# Altium schematic sheet Buck_converter.SchDoc
size B
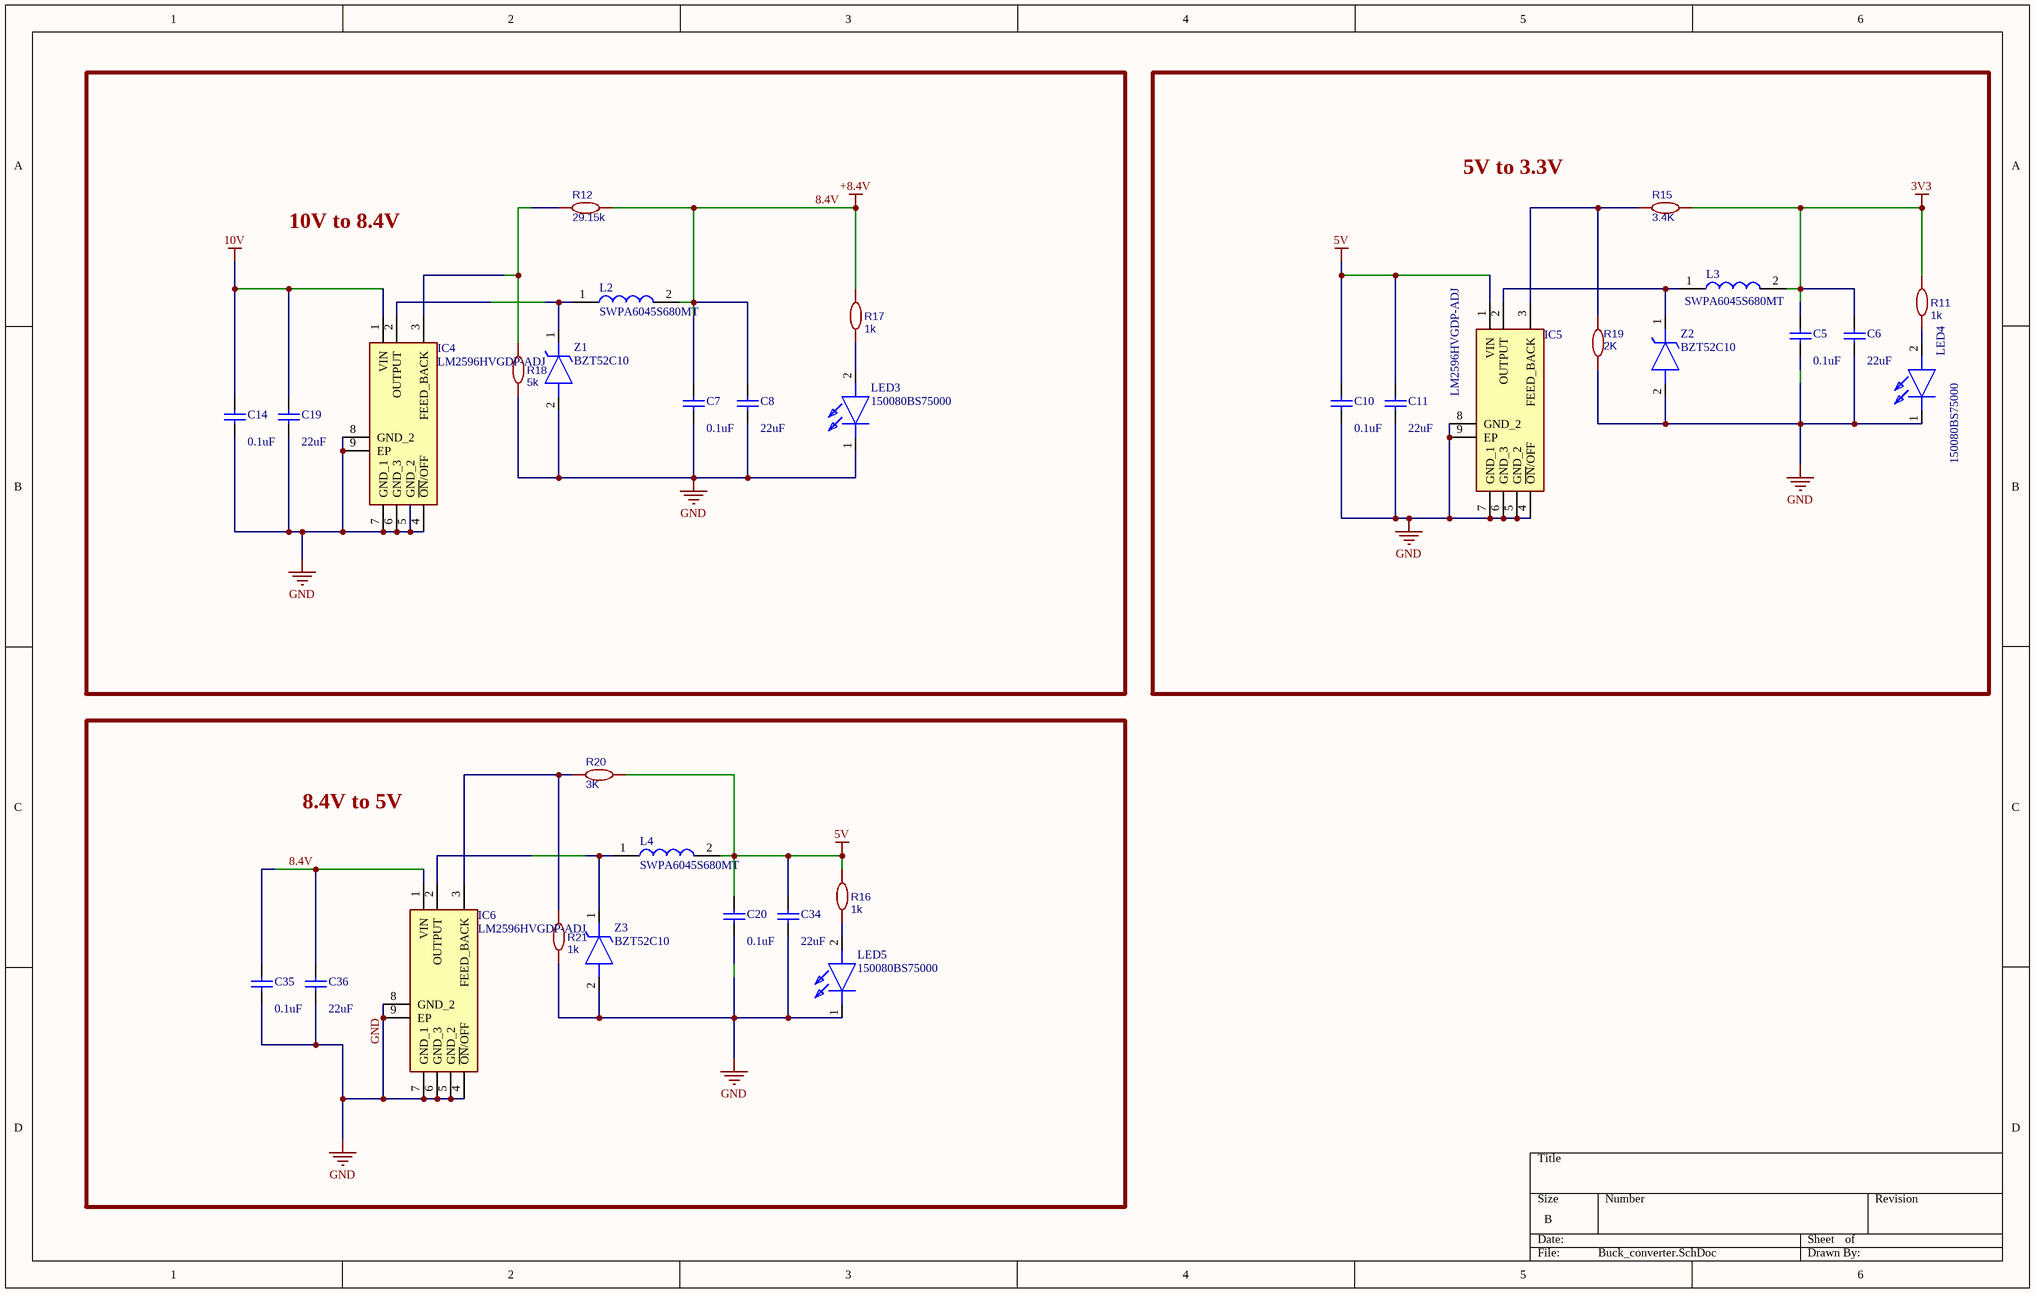
[diagram p0: Buck_converter.SchDoc]

## Parts
C5  value 0.1uF  [C0805]  (hidden comment: C1711)
C6  value 22uF  [C0805]  (hidden comment: C86816)
C7  value 0.1uF  [C0805]  (hidden comment: C1711)
C8  value 22uF  [C0805]  (hidden comment: C86816)
C10  value 0.1uF  [C0805]  (hidden comment: C1711)
C11  value 22uF  [C0805]  (hidden comment: C86816)
C14  value 0.1uF  [C0805]  (hidden comment: C1711)
C19  value 22uF  [C0805]  (hidden comment: C86816)
C20  value 0.1uF  [C0805]  (hidden comment: C1711)
C34  value 22uF  [C0805]  (hidden comment: C86816)
C35  value 0.1uF  [C0805]  (hidden comment: C1711)
C36  value 22uF  [C0805]  (hidden comment: C86816)
IC4  LM2596HVGDP-ADJ  [SOP-8-PP_L4.9-W3.9-P1.27-LS6.0-BL-EP]
IC5  LM2596HVGDP-ADJ  [SOP-8-PP_L4.9-W3.9-P1.27-LS6.0-BL-EP]
IC6  LM2596HVGDP-ADJ  [SOP-8-PP_L4.9-W3.9-P1.27-LS6.0-BL-EP]
L2  SWPA6045S680MT  [SWPA6045S680MT]
L3  SWPA6045S680MT  [SWPA6045S680MT]
L4  SWPA6045S680MT  [SWPA6045S680MT]
LED3  150080BS75000  [LEDC2012X80N]
LED4  150080BS75000  [LEDC2012X80N]
LED5  150080BS75000  [LEDC2012X80N]
R11  1k  [R0402]
R12  29.15k  [R0402]
R15  3.4K  [R0402]
R16  1k  [R0402]
R17  1k  [R0402]
R18  5k  [R0402]
R19  2K  [R0402]
R20  3K  [R0402]
R21  1k  [R0402]
Z1  BZT52C10  [SOD3716X125N]
Z2  BZT52C10  [SOD3716X125N]
Z3  BZT52C10  [SOD3716X125N]

## Blocks framed on the sheet
10V to 8.4V: C7 C8 C14 C19 IC4 L2 LED3 R12 R17 R18 Z1
5V to 3.3V: C5 C6 C10 C11 IC5 L3 LED4 R11 R15 R19 Z2
8.4V to 5V: C20 C34-C36 IC6 L4 LED5 R16 R20 R21 Z3

## Nets
3V3: C5.2 C6.2 L3.2 R11.2 R15.1
5V: C10.2 C11.2 C20.2 C34.2 IC5.1(VIN) L4.2 R16.2 R20.1
8.4V: C7.2 C8.2 C35.2 C36.2 IC6.1(VIN) L2.2 R12.1 R17.2  [also labelled +8.4V]
10V: C14.2 C19.2 IC4.1(VIN)
GND: C5.1 C6.1 C7.1 C8.1 C10.1 C11.1 C14.1 C19.1 C20.1 C34.1 C35.1 C36.1 IC4.4(~{ON}/OFF) IC4.5(GND_2) IC4.6(GND_3) IC4.7(GND_1) IC4.8(GND_2) IC4.9(EP) IC5.4(~{ON}/OFF) IC5.5(GND_2) IC5.6(GND_3) IC5.7(GND_1) IC5.8(GND_2) IC5.9(EP) IC6.4(~{ON}/OFF) IC6.5(GND_2) IC6.6(GND_3) IC6.7(GND_1) IC6.8(GND_2) IC6.9(EP) LED3.1(K) LED4.1(K) LED5.1(K) R18.1 R19.2 R21.1 Z1.2(A) Z2.2(A) Z3.2(A)
NetIC4_2: IC4.2(OUTPUT) L2.1 Z1.1(K)
NetIC4_3: IC4.3(FEED_BACK) R12.2 R18.2
NetIC5_2: IC5.2(OUTPUT) L3.1 Z2.1(K)
NetIC5_3: IC5.3(FEED_BACK) R15.2 R19.1
NetIC6_2: IC6.2(OUTPUT) L4.1 Z3.1(K)
NetIC6_3: IC6.3(FEED_BACK) R20.2 R21.2
NetLED3_2: LED3.2(A) R17.1
NetLED4_2: LED4.2(A) R11.1
NetLED5_2: LED5.2(A) R16.1

## Library data of the parts
C5-C8 C10 C11 C14 C19 C20 C34-C36 = Cap: Capacitor; Published: 8-Jun-2000; LatestRevisionDate: 17-Jul-2002; LatestRevisionNote: Re-released for DXP Platform.; PackageReference: RAD-0.3; Publisher: Altium Limited; PackageDescription: Radial Cap, Thru-Hole; 2 Leads; 0.3 in Pin Spacing; JLC part: C123456
IC4-IC6 = LM2596HVGDP-ADJ: Integrated Circuit; Manufacturer_Name: Texas Instruments; Datasheet Link: https://www.ti.com/lit/ds/symlink/lm2596.pdf?HQS=ti-null-null-sf-df-pf-sep-wwe&ts=1592978195629; Height: 4.57mm; Manufacturer_Part_Number: LM2596HVGDP-ADJ; Mouser Part Number: LM2596HVGDP-ADJ; Mouser Price/Stock: https://www.mouser.co.uk/ProductDetail/Texas-Instruments/LM2596S-ADJ?qs=X1J7HmVL2ZGmRmhAtwKZ2Q%3D%3D
L2-L4 = SWPA6045S680MT: Inductor; Manufacturer_Name: SUNLORD; Datasheet Link: https://datasheet.lcsc.com/lcsc/2110091630_Sunlord-SWPA6045S680MT_C53663.pdf; Height: 4.5mm; Manufacturer_Part_Number: SWPA6045S680MT; JLC part: C53663
LED3-LED5 = 150080BS75000: LED; Manufacturer_Name: Wurth Elektronik; Datasheet Link: https://katalog.we-online.com/led/datasheet/150080BS75000.pdf; Height: 0.8mm; Manufacturer_Part_Number: 150080BS75000; Mouser Part Number: 710-150080BS75000; Mouser Price/Stock: https://www.mouser.co.uk/ProductDetail/Wurth-Elektronik/150080BS75000?qs=2kOmHSv6VfT2tBo3UPVqAQ%3D%3D; JLC part: C6067133
R11 R16 R17 = 1k: nameAlias: Value(Ω); Manufacturer Part: ?; spicePre: R; spiceSymbolName: Resistor; JLC part: C11702
R12 R15 R18-R21 = 10k: nameAlias: Value(Ω); Manufacturer Part: ?; spicePre: R; spiceSymbolName: Resistor
  R12: JLC part: C102812
  R15: JLC part: C273342
  R18: JLC part: C477765
  R19: JLC part: C325372
  R20: JLC part: C168223
  R21: JLC part: C163815
Z1-Z3 = BZT52C10: Zener Diode; Manufacturer_Name: Multicomp Pro; Datasheet Link: https://www.farnell.com/datasheets/3006306.pdf; Height: 1.25mm; Manufacturer_Part_Number: BZT52C10; JLC part: C2103